# Altium project Adapter_Board-v2.0.PrjPcb
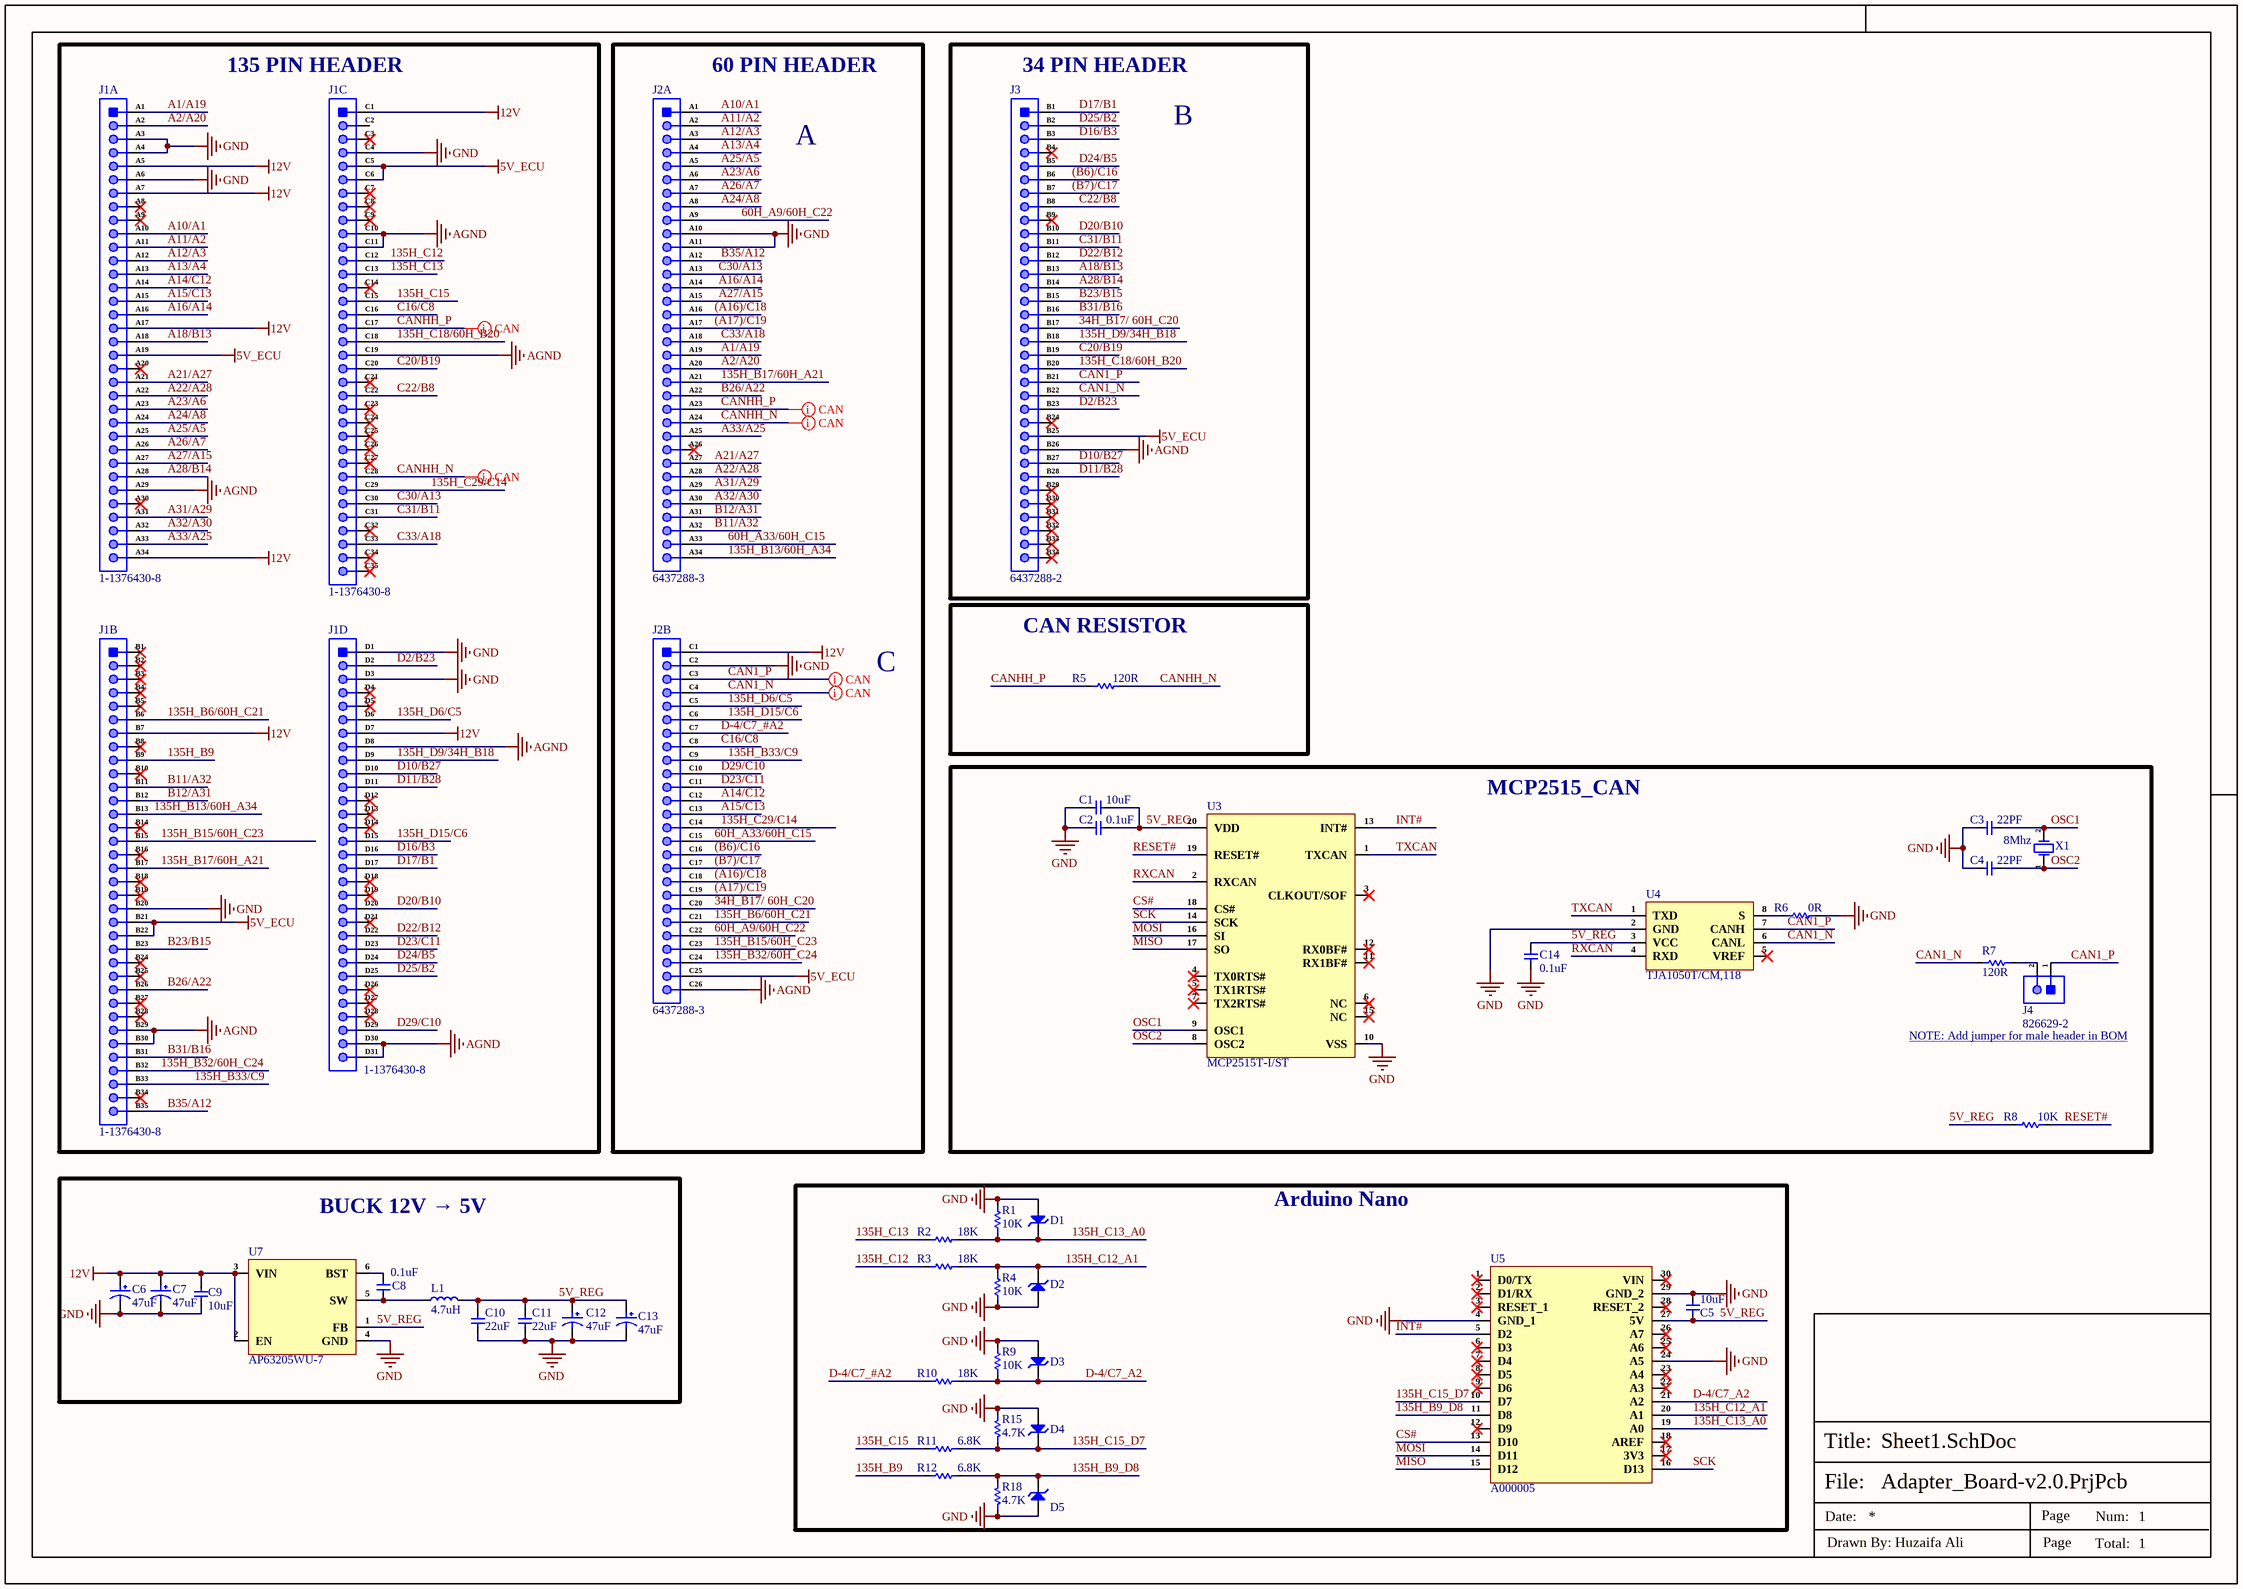
[diagram p0: Sheet1.SchDoc]
1 sheet, 43 parts. Net scope: global (net labels, ports and power ports of the same name join across sheets).
Board file: PCB_Adaptor_Board-v2.0.PcbDoc

## Sheet Sheet1.SchDoc
size 420 x 297 mm; SheetNumber: 1; SheetTotal: 1

### Parts
C1  10uF  [Cap-0603]
C2  0.1uF  [Cap-0603]
C3  22PF  [Cap-0402]
C4  22PF  [Cap-0402]
C5  10uF  [Cap-0603]
C6  47uF  [RVT1E470M0505]
C7  47uF  [RVT1E470M0505]
C8  0.1uF  [Cap-0603]
C9  10uF  [Cap-0603]
C10  22uF  [Cap-0603]
C11  22uF  [Cap-0603]
C12  47uF  [CS1C470M-CRD54]
C13  47uF  [CS1C470M-CRD54]
C14  0.1uF  [Cap-0603]
D1  BZT52C5V1S-7-F  [SOD-323]  (value not drawn)
D2  BZT52C5V1S-7-F  [SOD-323]  (value not drawn)
D3  BZT52C5V1S-7-F  [SOD-323]  (value not drawn)
D4  BZT52C5V1S-7-F  [SOD-323]  (value not drawn)
D5  BZT52C5V1S-7-F  [SOD-323]  (value not drawn)
J1  1-1376430-8  [1-1376430-8]  (parts A,B,C,D of 4)
J2  6437288-3  [6437288-3]  (parts A,B of 2)
J3  6437288-2  [6437288-2]
J4  826629-2  [HDR1X2_]
L1  4.7uH  [SWPA3015S4R7MT_]
R1  10K  [Res-0603]
R2  18K  [Res-0603]
R3  18K  [Res-0603]
R4  10K  [Res-0603]
R5  120R  [Res-0603]
R6  0R  [Res-0603]
R7  120R  [Res-0603]
R8  10K  [Res-0603]
R9  10K  [Res-0603]
R10  18K  [Res-0603]
R11  6.8K  [Res-0603]
R12  6.8K  [Res-0603]
R15  4.7K  [Res-0603]
R18  4.7K  [Res-0603]
U3  MCP2515T-I/ST  [TSSOP-20]
U4  TJA1050T/CM,118  [SOP-8]
U5  A000005  [A000005]
U7  AP63205WU-7  [TSOT-23-6]
X1  8Mhz  [71008000RW1]

### Blocks framed on the sheet
135 PIN HEADER: J1
B: J3
CAN RESISTOR: R5
MCP2515_CAN: C1-C4 C14 J4 R6-R8 U3 U4 X1
BUCK 12V → 5V: C6-C13 L1 U7
Arduino Nano: C5 D1-D5 R1-R4 R9-R12 R15 R18 U5

### Nets
5V_ECU: J1.A19 J1.B21 J1.B22 J1.C5 J1.C6 J2.C25 J3.B25
12V: C6.1 C7.1 C9.2 J1.A5 J1.A7 J1.A17 J1.A34 J1.B7 J1.C1 J1.D7 J2.C1 U7.2(EN) U7.3(VIN)
AGND: J1.A29 J1.B29 J1.B30 J1.C10 J1.C11 J1.C19 J1.D8 J1.D30 J1.D31 J2.C26 J3.B26
GND: C1.1 C2.1 C3.1 C4.1 C5.2 C6.2 C7.2 C9.1 C10.1 C11.1 C12.2 C13.2 C14.1 D1.2(A) D2.2(A) D3.2(A) D4.2(A) D5.2(A) J1.A3 J1.A4 J1.A6 J1.B20 J1.C4 J1.D1 J1.D3 J2.A10 J2.A11 J2.C2 R1.2 R4.1 R6.2 R9.2 R15.2 R18.1 U3.10(VSS) U4.2(GND) U5.4(GND_1) U5.24(A5) U5.29(GND_2) U7.4(GND)
5V_REG: C1.2 C2.2 C5.1 C10.2 C11.2 C12.1 C13.1 C14.2 L1.2 R8.2 U3.20(VDD) U4.3(VCC) U5.27(5V) U7.1(FB)
34H_B17/ 60H_C20: J2.C20 J3.B17
60H_A9/60H_C22: J2.A9 J2.C22
60H_A33/60H_C15: J2.A33 J2.C15
135H_B6/60H_C21: J1.B6 J2.C21
135H_B9: J1.B9 R12.1
135H_B9_D8: D5.1(K) R12.2 R18.2 U5.11(D8)
135H_B13/60H_A34: J1.B13 J2.A34
135H_B15/60H_C23: J1.B15 J2.C23
135H_B17/60H_A21: J1.B17 J2.A21
135H_B32/60H_C24: J1.B32 J2.C24
135H_B33/C9: J1.B33 J2.C9
135H_C12: J1.C12 R3.1
135H_C12_A1: D2.1(K) R3.2 R4.2 U5.20(A1)
135H_C13: J1.C13 R2.1
135H_C13_A0: D1.1(K) R1.1 R2.2 U5.19(A0)
135H_C15: J1.C15 R11.1
135H_C15_D7: D4.1(K) R11.2 R15.1 U5.10(D7)
135H_C18/60H_B20: J1.C18 J3.B20
135H_C29/C14: J1.C29 J2.C14
135H_D6/C5: J1.D6 J2.C5
135H_D9/34H_B18: J1.D9 J3.B18
135H_D15/C6: J1.D15 J2.C6
(A16)/C18: J2.A16 J2.C18
(A17)/C19: J2.A17 J2.C19
(B6)/C16: J2.C16 J3.B6
(B7)/C17: J2.C17 J3.B7
A1/A19: J1.A1 J2.A19
A2/A20: J1.A2 J2.A20
A10/A1: J1.A10 J2.A1
A11/A2: J1.A11 J2.A2
A12/A3: J1.A12 J2.A3
A13/A4: J1.A13 J2.A4
A14/C12: J1.A14 J2.C12
A15/C13: J1.A15 J2.C13
A16/A14: J1.A16 J2.A14
A18/B13: J1.A18 J3.B13
A21/A27: J1.A21 J2.A27
A22/A28: J1.A22 J2.A28
A23/A6: J1.A23 J2.A6
A24/A8: J1.A24 J2.A8
A25/A5: J1.A25 J2.A5
A26/A7: J1.A26 J2.A7
A27/A15: J1.A27 J2.A15
A28/B14: J1.A28 J3.B14
A31/A29: J1.A31 J2.A29
A32/A30: J1.A32 J2.A30
A33/A25: J1.A33 J2.A25
B11/A32: J1.B11 J2.A32
B12/A31: J1.B12 J2.A31
B23/B15: J1.B23 J3.B15
B26/A22: J1.B26 J2.A22
B31/B16: J1.B31 J3.B16
B35/A12: J1.B35 J2.A12
C16/C8: J1.C16 J2.C8
C20/B19: J1.C20 J3.B19
C22/B8: J1.C22 J3.B8
C30/A13: J1.C30 J2.A13
C31/B11: J1.C31 J3.B11
C33/A18: J1.C33 J2.A18
CAN1_N: J2.C4 J3.B22 R7.2 U4.6(CANL)
CAN1_P: J2.C3 J3.B21 J4.1 U4.7(CANH)
CANHH_N: J1.C28 J2.A24 R5.2
CANHH_P: J1.C17 J2.A23 R5.1
CS#: U3.18(CS#) U5.13(D10)
D2/B23: J1.D2 J3.B23
D10/B27: J1.D10 J3.B27
D11/B28: J1.D11 J3.B28
D16/B3: J1.D16 J3.B3
D17/B1: J1.D17 J3.B1
D20/B10: J1.D20 J3.B10
D22/B12: J1.D22 J3.B12
D23/C11: J1.D23 J2.C11
D24/B5: J1.D24 J3.B5
D25/B2: J1.D25 J3.B2
D29/C10: J1.D29 J2.C10
D-4/C7_#A2: J2.C7 R10.1
D-4/C7_A2: D3.1(K) R9.1 R10.2 U5.21(A2)
INT#: U3.13(INT#) U5.5(D2)
MISO: U3.17(SO) U5.15(D12)
MOSI: U3.16(SI) U5.14(D11)
OSC1: C3.2 U3.9(OSC1) X1.2(OSC2)
OSC2: C4.2 U3.8(OSC2) X1.1(OSC1)
RESET#: R8.1 U3.19(RESET#)
RXCAN: U3.2(RXCAN) U4.4(RXD)
SCK: U3.14(SCK) U5.16(D13)
TXCAN: U3.1(TXCAN) U4.1(TXD)
NetC8_1: C8.1 L1.1 U7.5(SW)
NetC8_2: C8.2 U7.6(BST)
NetJ4_2: J4.2 R7.1
NetR6_1: R6.1 U4.8(S)

Not connected (* = marked no-connect by the designer): J1 A8* A9* A20* A30* B1* B2* B3* B4* B5* B8* B10* B14* B16* B18* B19* B24* B25* B27* B28* B34* C2 C3* C7* C8* C9* C14* C21* C23* C24* C25* C26* C27* C32* C34* C35* D4* D5* D12* D13* D14* D18* D19* D21* D26* D27* D28*; J2 A26*; J3 B4* B9* B24* B29* B30* B31* B32* B33* B34*; U3 3(CLKOUT/SOF)* 4(TX0RTS#)* 5(TX1RTS#)* 6(NC)* 7(TX2RTS#)* 11(RX1BF#)* 12(RX0BF#)* 15(NC)*; U4 5(VREF)*; U5 1(D0/TX)* 2(D1/RX)* 3(RESET_1)* 6(D3)* 7(D4)* 8(D5)* 9(D6)* 12(D9)* 17(3V3)* 18(AREF)* 22(A3)* 23(A4)* 25(A6)* 26(A7)* 28(RESET_2)* 30(VIN)*

### Layout directives
differential pair; rule Matched Net Lengths [Tolerance = 20mil]; rule Impedance Constraint [Min = 118.0    Max = 120.0    ]: CAN1_N, CAN1_P, CANHH_N, CANHH_P

### Notes on the sheet
- 60 PIN HEADER
- (near J3) 34 PIN HEADER
- A
- C
- NOTE: Add jumper for male header in BOM <https://www.lcsc.com/product-detail/Shunts-Jumpers_BOOMELE-Boom-Precision-Elec-2-54_C100114.html>
- File:
- Title:
- Date:
- Page
- Num:
- Total:
- Drawn By: Huzaifa Ali

### Library data of the parts
C1 C5 C9 = CL10A106MA8NRNC: CAP CER 10UF 25V X5R 0603; Manufacturer: Samsung; Tolerance: 20%; Supplier 1: Avnet; Manufacturer Part Number: CL10A106MA8NRNC; RoHS: Yes; Category: Ceramic Capacitors; Pricing 1: 4000=0.03753, 8000=0.03700, 16000=0.03595, 24000=0.03515, 32000=0.03383, 40000=0.03304, 400000=0.03225 (USD); Mount: Surface Mount; Case/Package: 0603; Case Code (Metric): 1608; Case Code (Imperial): 0603; Contact Plating: Tin; Min Operating Temperature: -55°C; Max Operating Temperature: 85°C; Package Quantity: 1; Packaging: Tape and Reel; Capacitance: 10uF; Voltage Rating: 25V; Dielectric: X5R; Termination: Wraparound; Series: CL; Construction: Flat; Length: 0.063inch; Width: 0.031inch; Thickness: 0.035inch; Lead Free: Lead Free; RoHS Compliant: Yes; ComponentLink1URL: https://datasheet.ciiva.com/25766/cl10a106ma8nrnc-25766562.pdf?src-supplier=Digi-Key; ComponentLink1Description: https://datasheet.ciiva.com/25766/cl10a106ma8nrnc-25766562.pdf?src-supplier=Digi-Key; Supplier Part Number 1: CL10A106MA8NRNC; LCSC Part Number: C96446
C2 C14 = CC0603JRX7R8BB104: CAP CER 0.1UF 25V X7R 0603; Manufacturer: Yageo; Item Type: Capacitors; Tolerance: 5%; Value: 100nF; Supplier: Digikey; LCSC Part Number: C327087; Manufacturer Part Number: CC0603JRX7R8BB104; RoHS: Yes; Stock: 448767; Pricing: 1=0.1, 10=0.057, 50=0.039, 100=0.0335, 500=0.02436, 1000=0.0215 (USD); Mounting Technology: Surface Mount; Case/Package: 0603; Case Code (Imperial): 0603; Case Code (Metric): 1608; Weight: 7.1E-05oz; Min Operating Temperature: -55°C; Max Operating Temperature: 125°C; Voltage Rating: 25V; Voltage Rating (DC): 25V; Packaging: Tape and Reel; Dielectric: X7R; Termination: SMD/SMT; Series: CC; Construction: Flat; Length: 1.6mm; Width: 0.031inch; Height: 0.8mm; Thickness: 0.035inch; Lead Free: Lead Free; Halogen Free: Halogen Free; RoHS Compliant: Yes; ComponentLink1URL: https://datasheet.ciiva.com/11465/upy-gphc-x7r-6-3v-to-50v-8-11465031.pdf?src-supplier=Avnet; ComponentLink1Description: https://datasheet.ciiva.com/11465/upy-gphc-x7r-6-3v-to-50v-8-11465031.pdf?src-supplier=Avnet
C3 C4 = CC0402JRNPO9BN220: CAP CER 22PF 50V C0G/NPO 0402; Manufacturer: Yageo; Dielectric Material: Ceramic; Tolerance: 5%; Dielectric: C0G; Temperature Coefficient: 30ppm/°C; Insulation Resistance: 100GR; Item Type: Capacitor; Supplier 1: Future Electronics; Manufacturer Part Number: CC0402JRNPO9BN220; RoHS: Yes; Category: Ceramic Capacitors; Stock 1: 200000; Pricing 1: 10000=0.00220, 40000=0.00210, 150000=0.00200, 400000=0.00190, 1000000=0.00180 (USD); Mounting Technology: Surface Mount; Case/Package: 0402; Pins: 2; Case Code (Metric): 1005; Case Code (Imperial): 0402; Min Operating Temperature: -55°C; Max Operating Temperature: 125°C; Value: 22pF; Voltage Rating: 50V; Packaging: Tape and Reel; Package Quantity: 1; Voltage Rating (DC): 50V; Termination: SMD/SMT; Resistor Type: Ceramic; Voltage: 50V; Series: CC; Length: 1mm; Width: 0.02inch; Height: 0.5mm; Thickness: 0.022inch; Depth: 0.5mm; Radiation Hardening: No; Reach SVHC Compliant: Yes; Lead Free: Lead Free; RoHS Compliant: Yes; ComponentLink1URL: https://datasheet.ciiva.com/5789/1443161-5789509.pdf?src-supplier=Farnell; ComponentLink1Description: https://datasheet.ciiva.com/5789/1443161-5789509.pdf?src-supplier=Farnell; ComponentLink2URL: https://datasheet.ciiva.com/8033/1443161-8033606.pdf?src-supplier=Element14; ComponentLink2Description: https://datasheet.ciiva.com/8033/1443161-8033606.pdf?src-supplier=Element14; ComponentLink3URL: https://datasheet.ciiva.com/7656/1132289-7656615.pdf?src-supplier=Element14; ComponentLink3Description: https://datasheet.ciiva.com/7656/1132289-7656615.pdf?src-supplier=Element14; ComponentLink4URL: https://datasheet.ciiva.com/8033/1443161-8033607.pdf?src-supplier=Element14; ComponentLink4Description: https://datasheet.ciiva.com/8033/1443161-8033607.pdf?src-supplier=Element14; ComponentLink5URL: https://datasheet.ciiva.com/8033/1443161-8033605.pdf?src-supplier=Element14; ComponentLink5Description: https://datasheet.ciiva.com/8033/1443161-8033605.pdf?src-supplier=Element14; ComponentLink6URL: https://datasheet.ciiva.com/143/mlccorderingcode-143987.pdf?src-supplier=Digi-Key; ComponentLink6Description: https://datasheet.ciiva.com/143/mlccorderingcode-143987.pdf?src-supplier=Digi-Key; ComponentLink7URL: https://datasheet.ciiva.com/143/mlccorderingcode-143986.pdf?src-supplier=Digi-Key; ComponentLink7Description: https://datasheet.ciiva.com/143/mlccorderingcode-143986.pdf?src-supplier=Digi-Key; ComponentLink8URL: https://datasheet.ciiva.com/143/mlccorderingcode-143988.pdf?src-supplier=Digi-Key; ComponentLink8Description: https://datasheet.ciiva.com/143/mlccorderingcode-143988.pdf?src-supplier=Digi-Key; ComponentLink9URL: https://datasheet.ciiva.com/5425/upy-gp-np0-16v-to-50v-8-5425483.pdf?src-supplier=Mouser; ComponentLink9Description: https://datasheet.ciiva.com/5425/upy-gp-np0-16v-to-50v-8-5425483.pdf?src-supplier=Mouser; ComponentLink10URL: https://datasheet.ciiva.com/15189/getdatasheetpartid-370074-15189117.pdf?src-supplier=Verical; ComponentLink10Description: https://datasheet.ciiva.com/15189/getdatasheetpartid-370074-15189117.pdf?src-supplier=Verical; Supplier Part Number 1: 9105957; LCSC Part Number: C106203
C6 C7 = RVT1E470M0505: 47uF 25V 49mA@120Hz ±20% SMD,D5xL5.4mm Aluminum Electrolytic Capacitors - SMD ROHS; Manufacturer: ROQANG; Manufacturer Part Number: RVT1E470M0505; Package: SMD,D5xL5.4mm; LCSC Part Number: C2977553; Item Type: Capacitor; ComponentLink1Description: LCSC; ComponentLink1URL: https://www.lcsc.com/product-detail/Aluminum-Electrolytic-Capacitors-SMD_ROQANG-RVT1E470M0505_C2977553.html
C8 = CL10B104KB8NNNC: CAP CER 0.1UF 50V X7R 0603; Manufacturer: Samsung; Material: Ceramic; Capacitance: 100nF; Tolerance: 10%; Supplier 1: Digi-Key; Manufacturer Part Number: CL10B104KB8NNNC; RoHS: Yes; Category: Ceramic Capacitors; Stock 1: 3998791; Pricing 1: 1=0.10000, 10=0.03000, 50=0.01640, 100=0.01340, 500=0.00954, 1000=0.00750 (USD); Mount: Surface Mount; Case/Package: 0603; Case Code (Metric): 1608; Case Code (Imperial): 0603; Contact Plating: Tin; Min Operating Temperature: -55°C; Max Operating Temperature: 125°C; Dielectric: X7R; Voltage Rating: 50V; Package Quantity: 1; Packaging: Tape and Reel; Voltage: 50V; Voltage Rating (DC): 50V; Series: CL; Construction: Flat; Length: 1.6mm; Width: 0.031inch; Height: 0.8mm; Depth: 0.8mm; Thickness: 0.035inch; Radiation Hardening: No; Lead Free: Lead Free; RoHS Compliant: Yes; ComponentLink1URL: https://datasheet.ciiva.com/25803/cl10b104kb8nnnc-25803393.pdf?src-supplier=Digi-Key; ComponentLink1Description: https://datasheet.ciiva.com/25803/cl10b104kb8nnnc-25803393.pdf?src-supplier=Digi-Key; ComponentLink2URL: https://datasheet.ciiva.com/26838/getdatasheetpartid-89097-26838411.pdf?src-supplier=Verical; ComponentLink2Description: https://datasheet.ciiva.com/26838/getdatasheetpartid-89097-26838411.pdf?src-supplier=Verical; ComponentLink3URL: https://datasheet.ciiva.com/29198/456651-da-01-en-vs-kondensator-0605-29198839.pdf?src-supplier=Conrad; ComponentLink3Description: https://datasheet.ciiva.com/29198/456651-da-01-en-vs-kondensator-0605-29198839.pdf?src-supplier=Conrad; Supplier Part Number 1: 1276-1000-1-ND; LCSC Part Number: C1591
C10 C11 = HGC0603R5226M160NTHJ: 16V 22uF X5R ±20% 0603 Multilayer Ceramic Capacitors MLCC - SMD/SMT ROHS; Manufacturer: Chinocera; Manufacturer Part Number: HGC0603R5226M160NTHJ; Package: 0603; LCSC Part Number: C22367828; Item Type: Capacitor; ComponentLink1Description: LCSC; ComponentLink1URL: https://www.lcsc.com/product-detail/Multilayer-Ceramic-Capacitors-MLCC-SMD-SMT_Chinocera-HGC0603R5226M160NTHJ_C22367828.html
C12 C13 = CS1C470M-CRD54: 47uF 16V ±20% SMD,D5xL5.4mm Aluminum Electrolytic Capacitors - SMD ROHS; Manufacturer: ST(Semtech); Manufacturer Part Number: CS1C470M-CRD54; Package: SMD,D5xL5.4mm; LCSC Part Number: C96178; Item Type: Capacitors; ComponentLink1Description: LCSC; ComponentLink1URL: https://www.lcsc.com/product-detail/Aluminum-Electrolytic-Capacitors-SMD_ST-Semtech-CS1C470M-CRD54_C96178.html
D1-D5 = BZT52C5V1S-7-F: DIODE ZENER 5.1V 200MW SOD323; Manufacturer: Diodes; Max Reverse Leakage Current: 1uA; Tolerance: 6%; Forward Voltage: 900mV; Impedance: 60R; Zener Current: 5mA; Output Current: 50mA; ESD Protection: No; Supplier: Future Electronics; LCSC Part Number: C151348; Manufacturer Part Number: BZT52C5V1S-7-F; RoHS: Yes; Item Type: Diodes; Stock: 30000; Pricing: 3000=0.0261, 9000=0.0252, 15000=0.0248, 60000=0.0236, 90000=0.0229 (USD); Mounting Technology: Surface Mount; Pins: 2; Weight: 0.000173oz; Contact Plating: Tin,Matte; Min Operating Temperature: -65°C; Max Operating Temperature: 150°C; Max Power Dissipation: 200mW; Zener Voltage: 5.1V; Packaging: Tape and Reel; Package Quantity: 3000; Power Dissipation: 200mW; Voltage Tolerance: 6%; Test Current: 5mA; Working Voltage: 5.1V; Max Reverse Current: 1uA; Termination: SMD/SMT; Power Rating: 200mW; Voltage Rating (DC): 5.1V; Series: -; Length: 1.8mm; Width: 1.4mm; Height: 1mm; Radiation Hardening: No; Lead Free: Lead Free; RoHS Compliant: Yes; ComponentLink1URL: https://datasheet.ciiva.com/15142/getdatasheetpartid-61177-15142295.pdf?src-supplier=Verical; ComponentLink1Description: https://datasheet.ciiva.com/15142/getdatasheetpartid-61177-15142295.pdf?src-supplier=Verical; ComponentLink2URL: https://datasheet.ciiva.com/25623/0900766b8104c1f1-25623741.pdf?src-supplier=Rs; ComponentLink2Description: https://datasheet.ciiva.com/25623/0900766b8104c1f1-25623741.pdf?src-supplier=Rs
J1 = 1-1376430-8: 025/040 135POS CAP ASSY H TIN; Manufacturer: TE Connectivity Raychem; Item Type: Connector; Supplier 1: Digikey; Manufacturer Part Number: 1-1376430-8; RoHS: Yes; Category: Connectors; Stock 1: 1632; Pricing 1: 1=11.55, 12=10.02667 (USD); Supplier Part Number 1: 17-1-1376430-8-ND
J2 = 6437288-3: CONN HEADER R/A 60POS 3MM; Manufacturer: TE Connectivity; Item Type: Connector; Supplier 1: Digikey; Manufacturer Part Number: 6437288-3; RoHS: Yes; Category: Headers and Wire Housings; Stock 1: 2119; Pricing 1: 1=23.56, 16=19.44938, 104=16.70635, 504=15.95829 (USD); ComponentLink1URL: https://datasheet.ciiva.com/11742/0900766b80fa0058-11742813.pdf?src-supplier=Rs; ComponentLink1Description: https://datasheet.ciiva.com/11742/0900766b80fa0058-11742813.pdf?src-supplier=Rs; ComponentLink2URL: https://datasheet.ciiva.com/31837/18928ddetrolleractionshowdocdocidcatalogsection7f1308072-2-gad-lit-31837713.pdf?src-supplier=Onlinecomponents.com; ComponentLink2Description: https://datasheet.ciiva.com/31837/18928ddetrolleractionshowdocdocidcatalogsection7f1308072-2-gad-lit-31837713.pdf?src-supplier=Onlinecomponents.com; ComponentLink3URL: https://datasheet.ciiva.com/9491/eng-cs-1308072-2-gad-lit-amp-superseal-0608-9491339.pdf?src-supplier=Avnet; ComponentLink3Description: https://datasheet.ciiva.com/9491/eng-cs-1308072-2-gad-lit-amp-superseal-0608-9491339.pdf?src-supplier=Avnet; Supplier Part Number 1: A122211-ND
J3 = 6437288-2: CONN HEADER R/A 34POS 3MM; Manufacturer: TE Connectivity; Item Type: Connectors; Supplier: Avnet; Supplier Part Number: 69AH5934; Manufacturer Part Number: 6437288-2; RoHS: Yes; Stock: 15; Pricing: 1=21.65, 5=21.15, 10=20.79, 25=20.4, 50=19.97 (USD); ComponentLink1URL: https://datasheet.ciiva.com/11755/0900766b80f79e47-11755892.pdf?src-supplier=Rs; ComponentLink1Description: https://datasheet.ciiva.com/11755/0900766b80f79e47-11755892.pdf?src-supplier=Rs; ComponentLink2URL: https://datasheet.ciiva.com/9496/eng-cs-1308072-2-gad-lit-amp-superseal-0608-9496917.pdf?src-supplier=Avnet; ComponentLink2Description: https://datasheet.ciiva.com/9496/eng-cs-1308072-2-gad-lit-amp-superseal-0608-9496917.pdf?src-supplier=Avnet
J4 = 826629-2: CONN HEADER VERT 2POS 2.54MM; Manufacturer: TE Connectivity; Manufacturer Part Number: 8266292; Number of Contacts: 2; Connector Type: Plug,Header,Pin; Current Rating: 3A; Board Standoff: No (Without); High Speed Serial Data Connector: No; PCB Mount Retention: Without; Gender: Male; PCB Mounting Orientation: Vertical; Contact Post Length: 0.1259inch; Plating Thickness: 0.8um; Item Type: Male Header; Supplier 1: RSComponents; RoHS: Yes; Category: Board to Board Connectors; Mount: Straddle Mount; Contact Plating: Gold,Tin; Contact Material: Bronze; Color: Green; Housing Color: Green; Housing Material: PBT; Contact Shape: Square; Min Operating Temperature: -65°C; Max Operating Temperature: 105°C; Number of Rows: 1; Termination: Through Hole; Number of Positions: 2; Packaging: Carton; Package Quantity: 3000; Series: AMPMODU MOD II; Contact Type: Male Pin; Contact Gender: Male; Orientation: Straight; Contact Protection: No (Without); Gasket: No (Without); High Temperature Housing: No; Keyed: No; Mating Alignment: No (Without); Mating Connector Lock: No (Without); Selectively Loaded: No (Without); Stabilizers: No (Without); Strain Relief: No (Without); Length: 5.08mm; Pitch: 2.54mm; Contact Mating Length: 6.7mm; Row Spacing: 2.54mm; Depth: 2.5mm; Radiation Hardening: No; Flammability Rating: UL94 V-0; REACH SVHC: No SVHC; ELV: Compliant; Lead Free: Lead Free; ComponentLink1URL: https://datasheet.ciiva.com/11746/0900766b80d7c358-11746248.pdf?src-supplier=RSComponents; ComponentLink1Description: https://datasheet.ciiva.com/11746/0900766b80d7c358-11746248.pdf?src-supplier=RSComponents; ComponentLink2URL: https://datasheet.ciiva.com/30224/8266292-30224019.pdf?src-supplier=Onlinecomponents.com; ComponentLink2Description: https://datasheet.ciiva.com/30224/8266292-30224019.pdf?src-supplier=Onlinecomponents.com; ComponentLink3URL: https://datasheet.ciiva.com/29369/001094754-da-01-en-stiftleiste-1-reihig-0-0826629-2-29369600.pdf?src-supplier=Conrad; ComponentLink3Description: https://datasheet.ciiva.com/29369/001094754-da-01-en-stiftleiste-1-reihig-0-0826629-2-29369600.pdf?src-supplier=Conrad; ComponentLink4URL: https://datasheet.ciiva.com/6857/eng-cd-826629-aa-basefilename-6857135.pdf?src-supplier=Digi-Key; ComponentLink4Description: https://datasheet.ciiva.com/6857/eng-cd-826629-aa-basefilename-6857135.pdf?src-supplier=Digi-Key; ComponentLink5URL: https://datasheet.ciiva.com/14120/eh826629-draw-14120837.pdf?src-supplier=Distrelec; ComponentLink5Description: https://datasheet.ciiva.com/14120/eh826629-draw-14120837.pdf?src-supplier=Distrelec; Supplier Part Number 1: 1361864; LCSC Part Number: C86471
L1 = SWPA3015S4R7MT: Fixed Ind 4.720%UH 0.125 Ohm 1400; Manufacturer: Sunlord; Supplier 1: Digi-Key; Manufacturer Part Number: SWPA3015S4R7MT; RoHS: Yes; Category: Fixed Inductors; Stock 1: 2802; Pricing 1: 1=0.41000, 10=0.36400, 25=0.31800, 50=0.27280, 100=0.25000, 250=0.22724, 500=0.21362, 1000=0.16362 (USD); RoHS Compliant: Yes; Supplier Part Number 1: 3442-SWPA3015S4R7MTCT-ND; LCSC Part Number: C19398
R1 R4 R9 = RT0603BRD0710KL: RES SMD 10K OHM 0.1% 1/10W 0603; Manufacturer: Yageo; Power: 100mW; Rated Temperature: 70°C; Value: 10kR; Temperature Coefficient: 25ppm/°C; Working Voltage: 75V; Package Height: 0.45mm; Package Length: 1.6mm; Package Width: 0.8mm; Item Type: Resistor; Supplier 1: Rs; Manufacturer Part Number: RT0603BRD0710KL; RoHS: Yes; Category: Chip SMD Resistors; Stock 1: 20510; Pricing 1: 100=0.29800, 250=0.27800, 500=0.25900, 1000=0.23700 (GBP); Mounting Technology: Surface Mount; Pins: 2; Case/Package: 0603; Min Operating Temperature: -55°C; Max Operating Temperature: 155°C; Tolerance: 0.1%; Resistor Type: FIXED RESISTOR; Construction: Chip; Package Style: SMTMeter; Packaging: Tape and Reel; Technology: THIN FILM; Termination: Wraparound; Reach SVHC Compliant: Yes; RoHS Compliant: Yes; ComponentLink1URL: https://datasheet.ciiva.com:443/pdfs/VipMasterIC/IC/YAGO/YAGO-S-A0008510989/YAGO-S-A0008510989-1.pdf?src-supplier=IHS+Markit; ComponentLink1Description: https://datasheet.ciiva.com:443/pdfs/VipMasterIC/IC/YAGO/YAGO-S-A0008510989/YAGO-S-A0008510989-1.pdf?src-supplier=IHS+Markit; ComponentLink2URL: https://datasheet.ciiva.com/5624/pyu-rt-1-to-0-05-rohs-l-4-5624351.pdf?src-supplier=Mouser; ComponentLink2Description: https://datasheet.ciiva.com/5624/pyu-rt-1-to-0-05-rohs-l-4-5624351.pdf?src-supplier=Mouser; ComponentLink3URL: https://datasheet.ciiva.com/29721/pyu-rt-1-to-0-05-rohs-l-4-29721177.pdf?src-supplier=Digi-Key; ComponentLink3Description: https://datasheet.ciiva.com/29721/pyu-rt-1-to-0-05-rohs-l-4-29721177.pdf?src-supplier=Digi-Key; Supplier Part Number 1: 1991391P; LCSC Part Number: C95204
R2 R3 R10 = RC0603FR-0718KL: RES 18K OHM 1% 1/10W 0603; Manufacturer: Yageo; Power Rating: 100mW; Voltage Rating: 75V; Voltage Rating (DC): 50V; Temperature Coefficient: 100ppm/°C; Resistance: 18kR; Supplier 1: Digi-Key; Supplier Part Number 1: 311-18.0KHRCT-ND; Manufacturer Part Number: RC0603FR-0718KL; RoHS: Yes; Category: Chip SMD Resistors; Stock 1: 1173301; Pricing 1: 1=0.10000, 10=0.02300, 100=0.00930, 1000=0.00417, 2500=0.00362 (USD); Case/Package: 0603; Number of Pins: 2; Case Code (Imperial): 0603; Case Code (Metric): 1608; Weight: 7.1E-05oz; Size Code: 0603; Min Operating Temperature: -55°C; Max Operating Temperature: 155°C; Resistor Type: Thick Film; Tolerance: 1%; Packaging: Tape and Reel; Termination: SMD/SMT; Features: Moisture Resistant; Series: RC; Max Power Dissipation: 100mW; Number of Terminations: 2; Resistance Tolerance: 1%; Technology: THICK FILM; Construction: Rectangular; Length: 1.6mm; Width: 0.8mm; Height: 0.45mm; Depth: 0.8mm; RoHS Compliant: Yes; REACH SVHC: Unknown; Military Standard: Not; Lead Free: Lead Free; ComponentLink1URL: https://datasheet.ciiva.com/11819/0900766b80f96399-11819270.pdf?src-supplier=RSComponents; ComponentLink1Description: https://datasheet.ciiva.com/11819/0900766b80f96399-11819270.pdf?src-supplier=RSComponents; ComponentLink2URL: https://datasheet.ciiva.com/7746/443971-7746268.pdf?src-supplier=Element14; ComponentLink2Description: https://datasheet.ciiva.com/7746/443971-7746268.pdf?src-supplier=Element14; ComponentLink3URL: https://datasheet.ciiva.com/7746/443971-7746269.pdf?src-supplier=Element14; ComponentLink3Description: https://datasheet.ciiva.com/7746/443971-7746269.pdf?src-supplier=Element14; ComponentLink4URL: https://datasheet.ciiva.com/15189/getdatasheetpartid-325162-15189626.pdf?src-supplier=Verical; ComponentLink4Description: https://datasheet.ciiva.com/15189/getdatasheetpartid-325162-15189626.pdf?src-supplier=Verical; Supplier 2: Digi-Key; Stock 2: 1087850; Pricing 2: 1=0.10000, 10=0.02300, 100=0.00930, 1000=0.00417, 2500=0.00362 (USD); Package Quantity: 5000; ComponentLink5URL: https://datasheet.ciiva.com/46395/443971-46395003.pdf?src-supplier=Element14; ComponentLink5Description: https://datasheet.ciiva.com/46395/443971-46395003.pdf?src-supplier=Element14; ComponentLink6URL: https://datasheet.ciiva.com/12558/rc0603-272842-12558744.pdf?src-supplier=Mouser; ComponentLink6Description: https://datasheet.ciiva.com/12558/rc0603-272842-12558744.pdf?src-supplier=Mouser; Supplier Part Number 2: 311-30.0KHRCT-ND; LCSC Part Number: C114610
R5 = RC0603FR-07120RL: RES 120 OHM 1% 1/10W 0603; Manufacturer: Yageo; Temperature Coefficient: 100ppm/°C; Voltage Rating (DC): 50V; Power Rating: 100mW; Item Type: Resistor; Supplier 1: Digi-Key; Manufacturer Part Number: RC0603FR-07120RL; RoHS: Yes; Category: Chip SMD Resistors; Stock 1: 839061; Pricing 1: 1=0.10000, 10=0.02400, 100=0.00970, 1000=0.00436, 2500=0.00378 (USD); Case/Package: 0603; Number of Pins: 2; Case Code (Metric): 1608; Case Code (Imperial): 0603; Size Code: 0603; Min Operating Temperature: -55°C; Max Operating Temperature: 155°C; Resistance: 120R; Tolerance: 1%; Resistor Type: Thick Film; Packaging: Tape and Reel; Voltage Rating: 50V; Package Quantity: 1; Number of Terminations: 2; Termination: SMD/SMT; Max Power Dissipation: 100mW; Features: Moisture Resistant; Series: RC; Construction: Rectangular; Resistance Tolerance: 1%; Length: 1.6mm; Width: 0.031inch; Height: 0.022inch; Depth: 0.8mm; REACH SVHC: No SVHC; Lead Free: Lead Free; Military Standard: Not; RoHS Compliant: Yes; ComponentLink1URL: https://datasheet.ciiva.com/2553/pyu-r-int-thick-7-2553512.pdf?src-supplier=Digi-Key; ComponentLink1Description: https://datasheet.ciiva.com/2553/pyu-r-int-thick-7-2553512.pdf?src-supplier=Digi-Key; ComponentLink2URL: https://datasheet.ciiva.com/7746/443971-7746248.pdf?src-supplier=Element14; ComponentLink2Description: https://datasheet.ciiva.com/7746/443971-7746248.pdf?src-supplier=Element14; ComponentLink3URL: https://datasheet.ciiva.com/2553/pyu-r-int-thick-7-2553513.pdf?src-supplier=Digi-Key; ComponentLink3Description: https://datasheet.ciiva.com/2553/pyu-r-int-thick-7-2553513.pdf?src-supplier=Digi-Key; ComponentLink4URL: https://datasheet.ciiva.com/7746/443971-7746249.pdf?src-supplier=Element14; ComponentLink4Description: https://datasheet.ciiva.com/7746/443971-7746249.pdf?src-supplier=Element14; ComponentLink5URL: https://datasheet.ciiva.com/2553/pyu-r-int-thick-7-2553514.pdf?src-supplier=Digi-Key; ComponentLink5Description: https://datasheet.ciiva.com/2553/pyu-r-int-thick-7-2553514.pdf?src-supplier=Digi-Key; ComponentLink6URL: https://datasheet.ciiva.com/46395/443971-46395021.pdf?src-supplier=Element14; ComponentLink6Description: https://datasheet.ciiva.com/46395/443971-46395021.pdf?src-supplier=Element14; Supplier Part Number 1: 311-120HRCT-ND; LCSC Part Number: C114640
R6 = RC0603JR-070RL: RES 0 OHM JUMPER 1/10W 0603; Manufacturer: Yageo; Resistance: 0mR; Tolerance: 1%; Power Rating: 100mW; Voltage Rating (DC): 50V; Temperature Coefficient: 200ppm/°C; Resistance Tolerance: 5%; Item Type: Resistor; Supplier 1: Digi-Key; Manufacturer Part Number: RC0603JR-070RL; RoHS: Yes; Category: Chip SMD Resistors; Stock 1: 18081776; Pricing 1: 1=0.10000, 10=0.01700, 25=0.01240, 50=0.00960, 100=0.00700, 250=0.00536, 500=0.00430, 1000=0.00316 (USD); Case/Package: 0603; Number of Pins: 2; Contact Plating: Tin,Matte; Case Code (Imperial): 0603; Case Code (Metric): 1608; Size Code: 0603; Min Operating Temperature: -55°C; Max Operating Temperature: 155°C; Resistor Type: Thick Film; Packaging: Tape and Reel; Termination: SMD/SMT; Series: RC; Technology: THICK FILM; Package Quantity: 5000; Voltage Rating: 50V; Features: Moisture Resistant; Max Power Dissipation: 100mW; Number of Terminations: 2; Construction: Rectangular; Length: 1.6mm; Width: 0.8mm; Height: 0.45mm; Depth: 0.8mm; Radiation Hardening: No; Reach SVHC Compliant: No SVHC; Lead Free: Lead Free; RoHS Compliant: Yes; Military Standard: Not; Supplier Part Number 1: 311-0.0GRCT-ND; LCSC Part Number: C95177
R7 = RC0603JR-07120RL: RES 120 OHM 5% 1/10W 0603; Manufacturer: Yageo; Voltage Rating (AC): 50V; Item Type: Resistor; Supplier: Future Electronics; Supplier Part Number: 4045720; Manufacturer Part Number: RC0603JR-07120RL; RoHS: Yes; Category: Chip SMD Resistors; Stock: 570000; Pricing: 5000=0.0015, 75000=0.0015, 250000=0.0014, 750000=0.0013, 2500000=0.0012 (USD); ComponentLink1URL: https://datasheet.ciiva.com/15189/getdatasheetpartid-326532-15189850.pdf?src-supplier=Verical; ComponentLink1Description: https://datasheet.ciiva.com/15189/getdatasheetpartid-326532-15189850.pdf?src-supplier=Verical; ComponentLink2URL: https://datasheet.ciiva.com/2518/pyu-r-int-thick-7-2518850.pdf?src-supplier=Digi-Key; ComponentLink2Description: https://datasheet.ciiva.com/2518/pyu-r-int-thick-7-2518850.pdf?src-supplier=Digi-Key; ComponentLink3URL: https://datasheet.ciiva.com/2518/pyu-r-int-thick-7-2518851.pdf?src-supplier=Digi-Key; ComponentLink3Description: https://datasheet.ciiva.com/2518/pyu-r-int-thick-7-2518851.pdf?src-supplier=Digi-Key; ComponentLink4URL: https://datasheet.ciiva.com/2518/pyu-r-int-thick-7-2518852.pdf?src-supplier=Digi-Key; ComponentLink4Description: https://datasheet.ciiva.com/2518/pyu-r-int-thick-7-2518852.pdf?src-supplier=Digi-Key; ComponentLink5URL: https://datasheet.ciiva.com/46395/443971-46395070.pdf?src-supplier=Element14; ComponentLink5Description: https://datasheet.ciiva.com/46395/443971-46395070.pdf?src-supplier=Element14; ComponentLink6URL: https://datasheet.ciiva.com/12555/rc0603-272842-12555246.pdf?src-supplier=Mouser; ComponentLink6Description: https://datasheet.ciiva.com/12555/rc0603-272842-12555246.pdf?src-supplier=Mouser; LCSC Part Number: C114681
R8 = RK73G1JTTD1002F: RES 10K OHM 1% 1/10W 0603; Item Type: Resistor; Value: 10kR; Power Rating: 100mW; Voltage Rating: 75V; Temperature Coefficient: 50ppm/°C; LCSC Part Number: C362180; ComponentLink1Description: LCSC; Supplier: Digi-Key; Supplier Part Number: 2019-RK73G1JTTD1002FCT-ND; RoHS: Yes; Category: Chip SMD Resistors; Stock: 249394; Pricing: 1=0.22, 10=0.118, 50=0.0812, 100=0.0699, 500=0.0513, 1000=0.04545 (USD); Case/Package: 0603; Case Code (Imperial): 0603; Case Code (Metric): 1608; Min Operating Temperature: -55°C; Max Operating Temperature: 125°C; Tolerance: 1%; Packaging: Tape and Reel; Termination: SMD/SMT; Series: RK73G; Construction: Rectangular; Length: 1.6mm; Depth: 0.8mm; Military Standard: Not; RoHS Compliant: Yes; ComponentLink2URL: http://www.mouser.com/ds/2/219/RK73G-9863.pdf?src-supplier=Mouser; ComponentLink2Description: http://www.mouser.com/ds/2/219/RK73G-9863.pdf?src-supplier=Mouser
R11 R12 = RT0603BRE076K8L: RES SMD 6.8K OHM 0.1% 1/10W 0603; Manufacturer: Yageo; Power: 100mW; Rated Temperature: 70°C; Value: 6.8kR; Temperature Coefficient: 50ppm/°C; Working Voltage: 75V; Package Height: 0.45mm; Package Length: 1.6mm; Package Width: 0.8mm; Item Type: Resistor; Supplier 1: Mouser; Manufacturer Part Number: RT0603BRE076K8L; RoHS: Yes; Category: Chip SMD Resistors; Stock 1: 1191; Pricing 1: 1=0.32000, 10=0.26800, 50=0.26800, 100=0.10500, 1000=0.04400, 10000=0.03600 (USD); Mounting Technology: Surface Mount; Pins: 2; Case/Package: 0603; Min Operating Temperature: -55°C; Max Operating Temperature: 155°C; Tolerance: 0.1%; Resistor Type: FIXED RESISTOR; Construction: Chip; Package Style: SMTMeter; Packaging: Tape and Reel; Technology: THIN FILM; Termination: Wraparound; Reach SVHC Compliant: Yes; RoHS Compliant: Yes; ComponentLink1URL: https://datasheet.ciiva.com:443/pdfs/VipMasterIC/IC/YAGO/YAGO-S-A0008510989/YAGO-S-A0008510989-1.pdf?src-supplier=IHS+Markit; ComponentLink1Description: https://datasheet.ciiva.com:443/pdfs/VipMasterIC/IC/YAGO/YAGO-S-A0008510989/YAGO-S-A0008510989-1.pdf?src-supplier=IHS+Markit; ComponentLink2URL: https://datasheet.ciiva.com/2584/pyu-rt-1-to-0-05-rohs-l-5-2584607.pdf?src-supplier=Digi-Key; ComponentLink2Description: https://datasheet.ciiva.com/2584/pyu-rt-1-to-0-05-rohs-l-5-2584607.pdf?src-supplier=Digi-Key; Supplier Part Number 1: 603-RT0603BRE076K8L; LCSC Part Number: C705876
R15 R18 = RC0603JR-074K7L: RES SMD 4.7K OHM 5% 1/10W 0603; Manufacturer: Yageo; Resistance: 4.7kR; Temperature Coefficient: 100ppm/°C; Voltage Rating (DC): 50V; Power Rating: 100mW; Item Type: Resistor; Supplier 1: Digi-Key; Manufacturer Part Number: RC0603JR-074K7L; Stock 1: 19706643; Pricing 1: 1=0.1, 10=0.02, 100=0.0081, 1000=0.00362, 2500=0.00314 (USD); Case/Package: 0603; Number of Pins: 2; Case Code (Imperial): 0603; Case Code (Metric): 1608; Min Operating Temperature: -55°C; Max Operating Temperature: 155°C; Tolerance: 5%; Composition: Thick Film; Packaging: Tape and Reel; Voltage Rating: 50V; Termination: SMD/SMT; Military Standard: Not; Length: 1.6mm; Width: 0.8mm; Depth: 0.8mm; REACH SVHC: No SVHC; Lead Free: Lead Free; ComponentLink1URL: http://www.farnell.com/datasheets/443971.pdf?src-supplier=Element14; ComponentLink1Description: http://www.farnell.com/datasheets/443971.pdf?src-supplier=Element14; Supplier Part Number 1: 311-4.7KGRCT-ND; LCSC Part Number: C105428
U3 = MCP2515T-I/ST: IC CAN CONTROLLER W/SPI 20TSSOP; Manufacturer: Microchip; Data Rate: 1Mbps; Max Supply Voltage: 5.5V; Min Supply Voltage: 2.7V; Interface: SPI,CAN; Number of Transmit Buffers: 3; Number of Receive Buffers: 2; Number of Interrupts: 1; Operating Supply Voltage: 5V; Max Supply Current: 10mA; Supplier: Digikey; LCSC Part Number: C185941; Manufacturer Part Number: MCP2515T-I/ST; RoHS: Yes; Item Type: IC; Stock: 8418; Pricing: 1=2.67, 25=2.23, 100=2.03 (USD); Mounting Technology: Surface Mount; Case/Package: TSSOP; Pins: 20; Min Operating Temperature: -40°C; Max Operating Temperature: 85°C; Packaging: Tape and Reel; Package Quantity: 2500; Number of Transceivers: 1; Number of Drivers: 1; Number of Receivers: 1; Series: -; Supply Current: 10mA; Nominal Supply Voltage: 5.5V; Length: 6.6mm; Width: 4.5mm; Height: 1.05mm; Radiation Hardening: No; Reach SVHC Compliant: No; Lead Free: Lead Free; RoHS Compliant: Yes; ComponentLink1URL: https://datasheet.ciiva.com/1495/1669372-1495293.pdf?src-supplier=Element14; ComponentLink1Description: https://datasheet.ciiva.com/1495/1669372-1495293.pdf?src-supplier=Element14; ComponentLink2URL: https://datasheet.ciiva.com/1495/1669372-1495085.pdf?src-supplier=Element14; ComponentLink2Description: https://datasheet.ciiva.com/1495/1669372-1495085.pdf?src-supplier=Element14; ComponentLink3URL: https://datasheet.ciiva.com/8084/21801e-8084590.pdf?src-supplier=Avnet; ComponentLink3Description: https://datasheet.ciiva.com/8084/21801e-8084590.pdf?src-supplier=Avnet; ComponentLink4URL: https://datasheet.ciiva.com/26818/getdatasheetpartid-446810-26818853.pdf?src-supplier=Verical; ComponentLink4Description: https://datasheet.ciiva.com/26818/getdatasheetpartid-446810-26818853.pdf?src-supplier=Verical; ComponentLink5URL: https://datasheet.ciiva.com/29118/filehandler-aspxddocname-en011733-29118715.pdf?src-supplier=Digikey; ComponentLink5Description: https://datasheet.ciiva.com/29118/filehandler-aspxddocname-en011733-29118715.pdf?src-supplier=Digikey; ComponentLink6URL: https://datasheet.ciiva.com/14152/mcp2515-eng-tds-14152536.pdf?src-supplier=Distrelec; ComponentLink6Description: https://datasheet.ciiva.com/14152/mcp2515-eng-tds-14152536.pdf?src-supplier=Distrelec; ComponentLink7URL: https://datasheet.ciiva.com/1503/21801e-1503903.pdf?src-supplier=Farnell; ComponentLink7Description: https://datasheet.ciiva.com/1503/21801e-1503903.pdf?src-supplier=Farnell; ComponentLink8URL: https://datasheet.ciiva.com/16200/filehandler-aspxddocname-en011733-16200958.pdf?src-supplier=Future+Electronics; ComponentLink8Description: https://datasheet.ciiva.com/16200/filehandler-aspxddocname-en011733-16200958.pdf?src-supplier=Future+Electronics; ComponentLink9URL: https://datasheet.ciiva.com/1696/21801g-1696565.pdf?src-supplier=Digikey; ComponentLink9Description: https://datasheet.ciiva.com/1696/21801g-1696565.pdf?src-supplier=Digikey; ComponentLink10URL: https://datasheet.ciiva.com/29118/filehandler-aspxddocname-en011733-29118716.pdf?src-supplier=Digikey; ComponentLink10Description: https://datasheet.ciiva.com/29118/filehandler-aspxddocname-en011733-29118716.pdf?src-supplier=Digikey; ComponentLink11URL: https://datasheet.ciiva.com/29118/filehandler-aspxddocname-en011733-29118714.pdf?src-supplier=Digikey; ComponentLink11Description: https://datasheet.ciiva.com/29118/filehandler-aspxddocname-en011733-29118714.pdf?src-supplier=Digikey
U4 = TJA1050T/CM,118: IC TRANSCEIVER HALF 1/1 8SO; Manufacturer: NXP Semiconductors; Supplier: Digikey; LCSC Part Number: C6952; Manufacturer Part Number: TJA1050T/CM,118; RoHS: Yes; Item Type: IC; Stock: 26815; Pricing: 1=1.89, 10=1.702, 25=1.606, 100=1.3682, 250=1.28472, 500=1.12412, 1000=0.93142 (USD); Height: 1.75mm; ComponentLink1URL: https://datasheet.ciiva.com/26933/getdatasheetpartid-747091-26933446.pdf?src-supplier=Verical; ComponentLink1Description: https://datasheet.ciiva.com/26933/getdatasheetpartid-747091-26933446.pdf?src-supplier=Verical; ComponentLink2URL: https://datasheet.ciiva.com/24191/tja1050-24191228.pdf?src-supplier=Future+Electronics; ComponentLink2Description: https://datasheet.ciiva.com/24191/tja1050-24191228.pdf?src-supplier=Future+Electronics; ComponentLink3URL: https://datasheet.ciiva.com/18624/tja1050-18624869.pdf?src-supplier=Digikey; ComponentLink3Description: https://datasheet.ciiva.com/18624/tja1050-18624869.pdf?src-supplier=Digikey; ComponentLink4URL: https://datasheet.ciiva.com/29891/tja1050-29891527.pdf?src-supplier=Avnet; ComponentLink4Description: https://datasheet.ciiva.com/29891/tja1050-29891527.pdf?src-supplier=Avnet
U5 = A000005: ARDUINO NANO ATMEGA328 EVAL BRD; Item Type: Module; Frequency: 16MHz; Memory Format: 4498,11064MemoryType; Max Supply Voltage: 12V; Memory Size: 32KB; Min Supply Voltage: 7V; Nominal Supply Current: 19mA; Number of I/Os: 22NUMBER; Supplier: Digikey; Supplier Part Number: 1050-1001-ND; Manufacturer: Arduino; Manufacturer Part Number: A000005; RoHS: Yes; Stock: 2276; Pricing: 1=24.9 (USD); ComponentLink1URL: https://datasheet.ciiva.com/1414/810078-1414124.pdf?src-supplier=Newark; ComponentLink1Description: https://datasheet.ciiva.com/1414/810078-1414124.pdf?src-supplier=Newark; ComponentLink2URL: https://datasheet.ciiva.com/4926/arduino-arduinoboardnano-188748-4926316.pdf?src-supplier=Mouser; ComponentLink2Description: https://datasheet.ciiva.com/4926/arduino-arduinoboardnano-188748-4926316.pdf?src-supplier=Mouser; ComponentLink3URL: https://datasheet.ciiva.com/2398/arduinonanomanual23-2398236.pdf?src-supplier=Digikey; ComponentLink3Description: https://datasheet.ciiva.com/2398/arduinonanomanual23-2398236.pdf?src-supplier=Digikey; ComponentLink4URL: https://datasheet.ciiva.com/1336/1682238-1336473.pdf?src-supplier=Element14; ComponentLink4Description: https://datasheet.ciiva.com/1336/1682238-1336473.pdf?src-supplier=Element14; ComponentLink5URL: https://datasheet.ciiva.com/19455/2121148-19455443.pdf?src-supplier=Jameco; ComponentLink5Description: https://datasheet.ciiva.com/19455/2121148-19455443.pdf?src-supplier=Jameco
U7 = AP63205WU-7: IC REG BUCK 5V 2A TSOT26; Manufacturer: Diodes; Supplier 1: Digi-Key; Manufacturer Part Number: AP63205WU-7; RoHS: Yes; Category: Voltage Regulators - Switching; Stock 1: 88525; Pricing 1: 1=0.88, 10=0.776, 25=0.7292, 100=0.5952, 250=0.55284, 500=0.4705, 1000=0.3764 (USD); Supplier Part Number 1: AP63205WU-7DICT-ND; LCSC Part Number: C2071056; Item Type: IC
X1 = 71008000RW1: 8MHz 20pF ±20ppm HC-49S Crystals ROHS; Manufacture: HD; Manufacture Part Number: 71008000RW1; LCSC Part Number: C655216; Package: HC-49S; Item Type: Crystal; ComponentLink1Description: LCSC; ComponentLink1URL: https://www.lcsc.com/product-detail/Crystals_HD-71008000RW1_C655216.html